# Altium schematic sheet TOP.SchDoc: TAXIMETRE_PCB_MAIN
size A4; Author: Burak YALIM; CompanyName: BARFAS; DrawnBy: Burak YALIM; DocumentNumber: 0; SheetNumber: 1; SheetTotal: 12
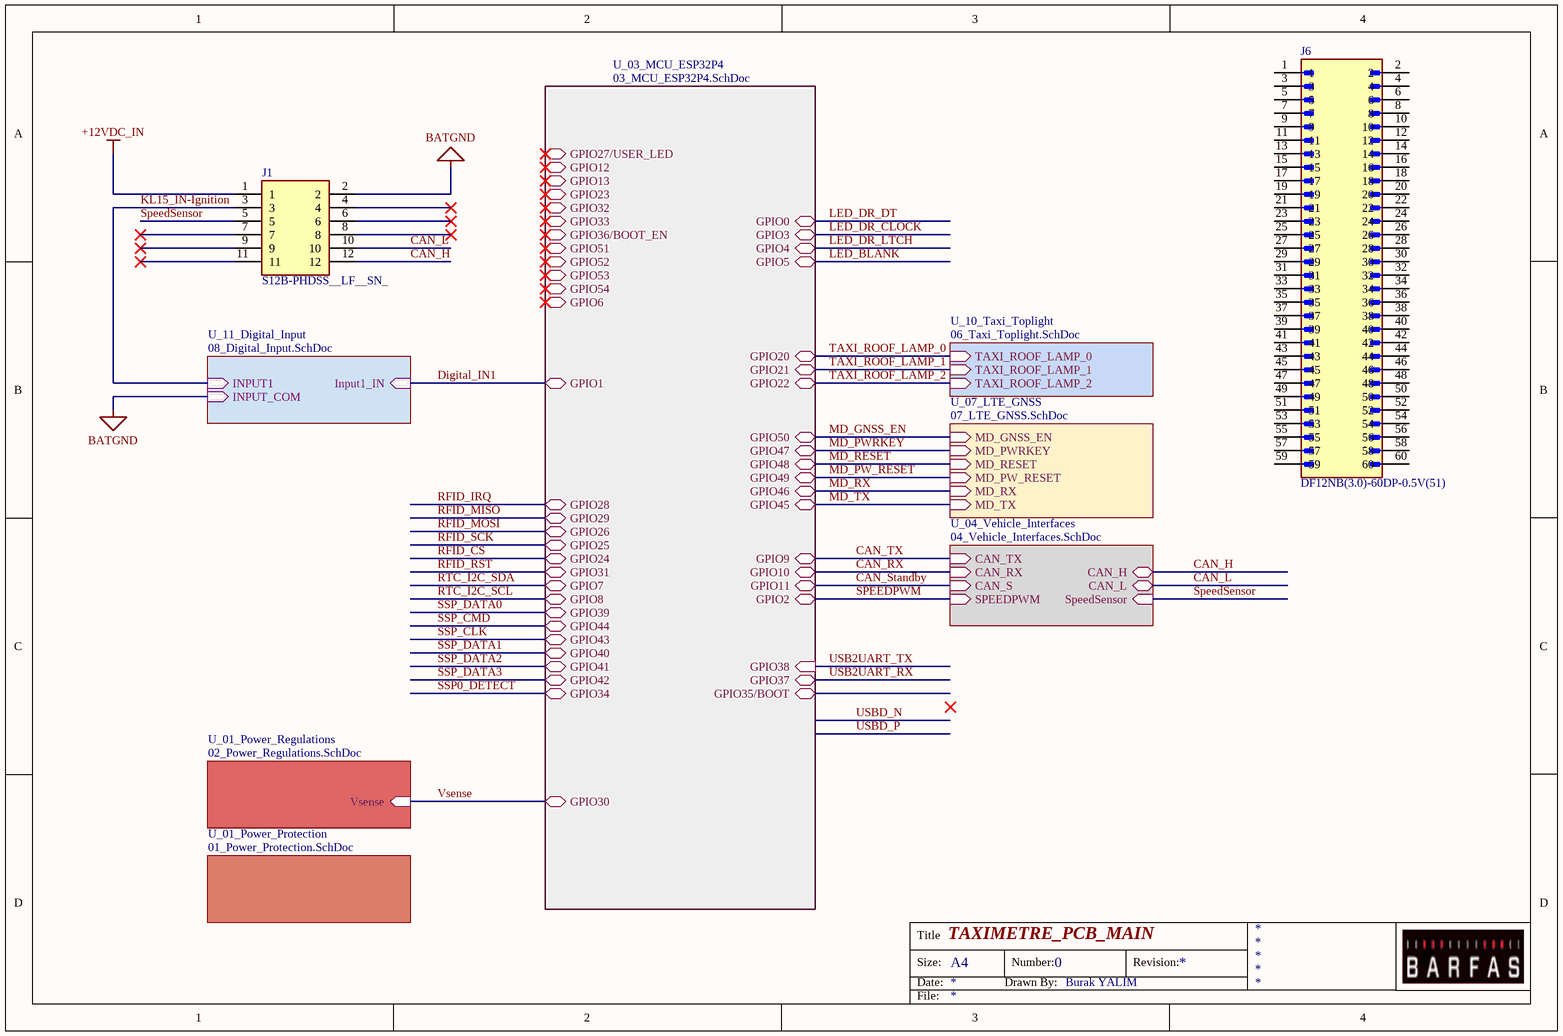
[diagram p0: TOP.SchDoc]

## Parts
J1  S12B-PHDSS__LF__SN_  [S12BPHDSSLFSN]
J6  DF12NB(3.0)-60DP-0.5V(51)  [HRS_DF12NB(3.0)-60DP-0.5V(51)]

## Sub-sheets
U_01_Power_Protection = 01_Power_Protection.SchDoc: no entries
U_01_Power_Regulations = 02_Power_Regulations.SchDoc: Vsense (in)
U_03_MCU_ESP32P4 = 03_MCU_ESP32P4.SchDoc: GPIO0 (bidir), GPIO1 (bidir), GPIO2 (bidir), GPIO3 (bidir), GPIO4 (bidir), GPIO5 (bidir), GPIO6 (bidir), GPIO7 (bidir), GPIO8 (bidir), GPIO9 (bidir), GPIO10 (bidir), GPIO11 (bidir), GPIO12 (bidir), GPIO13 (bidir), GPIO20 (bidir), GPIO21 (bidir), GPIO22 (bidir), GPIO23 (bidir), GPIO24 (bidir), GPIO25 (bidir), GPIO26 (bidir), GPIO27/USER_LED (bidir), GPIO28 (bidir), GPIO29 (bidir), GPIO30 (bidir), GPIO31 (bidir), GPIO32 (bidir), GPIO33 (bidir), GPIO34 (bidir), GPIO35/BOOT (bidir), GPIO36/BOOT_EN (bidir), GPIO37 (bidir), GPIO38 (in), GPIO39 (bidir), GPIO40 (bidir), GPIO41 (bidir), GPIO42 (bidir), GPIO43 (bidir), GPIO44 (bidir), GPIO45 (bidir), GPIO46 (bidir), GPIO47 (bidir), GPIO48 (bidir), GPIO49 (bidir), GPIO50 (bidir), GPIO51 (bidir), GPIO52 (bidir), GPIO53 (bidir), GPIO54 (bidir)
U_04_Vehicle_Interfaces = 04_Vehicle_Interfaces.SchDoc: CAN_TX (in), CAN_RX (in), CAN_S (in), SPEEDPWM (in), SpeedSensor (in), CAN_H (bidir), CAN_L (bidir)
U_07_LTE_GNSS = 07_LTE_GNSS.SchDoc: MD_GNSS_EN (in), MD_PWRKEY (in), MD_RESET (in), MD_PW_RESET (in), MD_RX (in), MD_TX (in)
U_10_Taxi_Toplight = 06_Taxi_Toplight.SchDoc: TAXI_ROOF_LAMP_0 (in), TAXI_ROOF_LAMP_1 (in), TAXI_ROOF_LAMP_2 (in)
U_11_Digital_Input = 08_Digital_Input.SchDoc: INPUT1 (in), Input1_IN (in), INPUT_COM (in)

## Nets
+12VDC_IN: J1.1
BATGND: J1.2 ; sheet U_11_Digital_Input/INPUT_COM
CAN_H: J1.12 ; sheet U_04_Vehicle_Interfaces/CAN_H
CAN_L: J1.10 ; sheet U_04_Vehicle_Interfaces/CAN_L
CAN_RX: sheet U_04_Vehicle_Interfaces/CAN_RX, sheet U_03_MCU_ESP32P4/GPIO10
CAN_Standby: sheet U_04_Vehicle_Interfaces/CAN_S, sheet U_03_MCU_ESP32P4/GPIO11
CAN_TX: sheet U_04_Vehicle_Interfaces/CAN_TX, sheet U_03_MCU_ESP32P4/GPIO9
Digital_IN1: sheet U_03_MCU_ESP32P4/GPIO1, sheet U_11_Digital_Input/Input1_IN
KL15_IN-Ignition: J1.3 ; sheet U_11_Digital_Input/INPUT1
LED_BLANK: sheet U_03_MCU_ESP32P4/GPIO5
LED_DR_CLOCK: sheet U_03_MCU_ESP32P4/GPIO3
LED_DR_DT: sheet U_03_MCU_ESP32P4/GPIO0
LED_DR_LTCH: sheet U_03_MCU_ESP32P4/GPIO4
MD_GNSS_EN: sheet U_07_LTE_GNSS/MD_GNSS_EN, sheet U_03_MCU_ESP32P4/GPIO50
MD_PW_RESET: sheet U_07_LTE_GNSS/MD_PW_RESET, sheet U_03_MCU_ESP32P4/GPIO49
MD_PWRKEY: sheet U_07_LTE_GNSS/MD_PWRKEY, sheet U_03_MCU_ESP32P4/GPIO47
MD_RESET: sheet U_07_LTE_GNSS/MD_RESET, sheet U_03_MCU_ESP32P4/GPIO48
MD_RX: sheet U_07_LTE_GNSS/MD_RX, sheet U_03_MCU_ESP32P4/GPIO46
MD_TX: sheet U_07_LTE_GNSS/MD_TX, sheet U_03_MCU_ESP32P4/GPIO45
RFID_CS: sheet U_03_MCU_ESP32P4/GPIO24
RFID_IRQ: sheet U_03_MCU_ESP32P4/GPIO28
RFID_MISO: sheet U_03_MCU_ESP32P4/GPIO29
RFID_MOSI: sheet U_03_MCU_ESP32P4/GPIO26
RFID_RST: sheet U_03_MCU_ESP32P4/GPIO31
RFID_SCK: sheet U_03_MCU_ESP32P4/GPIO25
RTC_I2C_SCL: sheet U_03_MCU_ESP32P4/GPIO8
RTC_I2C_SDA: sheet U_03_MCU_ESP32P4/GPIO7
SPEEDPWM: sheet U_04_Vehicle_Interfaces/SPEEDPWM, sheet U_03_MCU_ESP32P4/GPIO2
SpeedSensor: J1.5 ; sheet U_04_Vehicle_Interfaces/SpeedSensor
SSP0_DETECT: sheet U_03_MCU_ESP32P4/GPIO34
SSP_CLK: sheet U_03_MCU_ESP32P4/GPIO43
SSP_CMD: sheet U_03_MCU_ESP32P4/GPIO44
SSP_DATA0: sheet U_03_MCU_ESP32P4/GPIO39
SSP_DATA1: sheet U_03_MCU_ESP32P4/GPIO40
SSP_DATA2: sheet U_03_MCU_ESP32P4/GPIO41
SSP_DATA3: sheet U_03_MCU_ESP32P4/GPIO42
TAXI_ROOF_LAMP_0: sheet U_03_MCU_ESP32P4/GPIO20, sheet U_10_Taxi_Toplight/TAXI_ROOF_LAMP_0
TAXI_ROOF_LAMP_1: sheet U_03_MCU_ESP32P4/GPIO21, sheet U_10_Taxi_Toplight/TAXI_ROOF_LAMP_1
TAXI_ROOF_LAMP_2: sheet U_03_MCU_ESP32P4/GPIO22, sheet U_10_Taxi_Toplight/TAXI_ROOF_LAMP_2
USB2UART_RX: sheet U_03_MCU_ESP32P4/GPIO37
USB2UART_TX: sheet U_03_MCU_ESP32P4/GPIO38
Vsense: sheet U_03_MCU_ESP32P4/GPIO30, sheet U_01_Power_Regulations/Vsense

Not connected (* = marked no-connect by the designer): J1 4* 6* 7* 8* 9* 11*; J6 1 2 3 4 5 6 7 8 9 10 11 12 13 14 15 16 17 18 19 20 21 22 23 24 25 26 27 28 29 30 31 32 33 34 35 36 37 38 39 40 41 42 43 44 45 46 47 48 49 50 51 52 53 54 55 56 57 58 59 60

## Notes on the sheet
- Title
- Size:
- Date:
- A4
- Drawn By:
- Number:
- Revision:
- File:

## Library data of the parts
J1 = S12B-PHDSS__LF__SN_: Connector; Manufacturer_Name: JST (JAPAN SOLDERLESS TERMINALS); Manufacturer_Part_Number: S12B-PHDSS (LF)(SN); Datasheet Link: https://www.jst-mfg.com/product/pdf/eng/ePHD.pdf; Height: 5mm
J6 = DF12NB(3.0)-60DP-0.5V(51): 60 Position Connector Header, Outer Shroud Contacts Surface Mount Gold; MF: Hirose Electric Co Ltd; SnapEDA_Link: https://www.snapeda.com/parts/DF12NB(3.0)-60DP-0.5V(51)/Hirose/view-part/?ref=snap; Package: None; Value: *; MP: DF12NB(3.0)-60DP-0.5V(51); Check_prices: https://www.snapeda.com/parts/DF12NB(3.0)-60DP-0.5V(51)/Hirose/view-part/?ref=eda